# Altium project Ezlo_Voice_AssistantHUB.PrjPcb (part 2 of 10)

## Sheet WiFi_Module_Section.SchDoc
size A4; DocumentNumber: 21; SheetNumber: 21; SheetTotal: 27
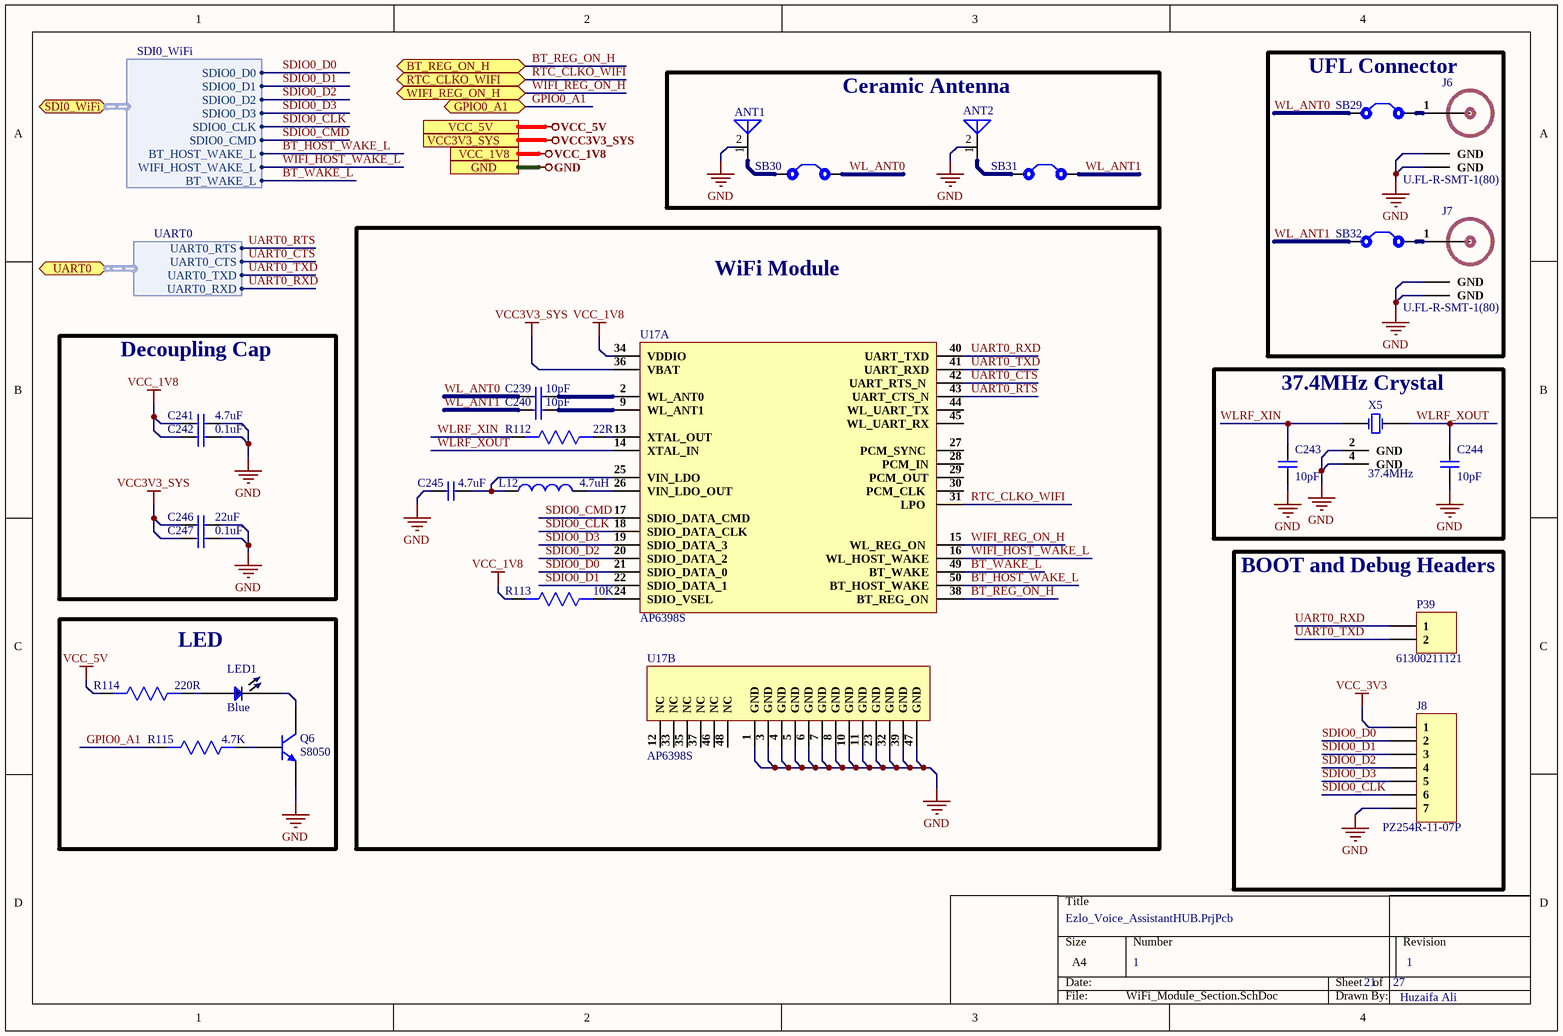
[diagram p2: WiFi_Module_Section.SchDoc]

### Parts
ANT1  RFANT5220110A2T  [RFANT5220110A2T]  (value not drawn)
ANT2  RFECA3216060K1T  [ANT 1206]  (value not drawn)
C239  10pF  [Cap0603]
C240  10pF  [Cap0603]
C241  4.7uF  [Cap0603]
C242  0.1uF  [Cap0402]
C243  10pF  [Cap0603]
C244  10pF  [Cap0603]
C245  4.7uF  [Cap0603]
C246  22uF  [Cap0805]
C247  0.1uF  [Cap0402]
J6  U.FL-R-SMT-1(80)  [U.FL-R-SMT-1(80)]
J7  U.FL-R-SMT-1(80)  [U.FL-R-SMT-1(80)]
J8  PZ254R-11-07P  [HDR1X7H]
L12  4.7uH  [SWPA4030S4R7MT]
LED1  Blue  [LED 0402]
P39  61300211121  [HDR1X2]
Q6  S8050  [SOT23-3]
R112  22R  [Res0603]
R113  10K  [Res0603]
R114  220R  [Res0603]
R115  4.7K  [Res0603]
SB29  Solder Bridge  [Solder Bridge]  (value not drawn)
SB30  Solder Bridge  [Solder Bridge]  (value not drawn)
SB31  Solder Bridge  [Solder Bridge]  (value not drawn)
SB32  Solder Bridge  [Solder Bridge]  (value not drawn)
U17  AP6398S  [AP6398S]  (parts A,B of 2)
X5  37.4MHz  [Q22FA12800078]

### Blocks framed on the sheet
Ceramic Antenna: ANT1 ANT2 SB30 SB31
UFL Connector: J6 J7 SB29 SB32
WiFi Module: C239 C240 C245 L12 R112 R113 U17
Decoupling Cap: C241 C242 C246 C247
37.4MHz Crystal: C243 C244 X5
BOOT and Debug Headers: J8 P39
LED: LED1 Q6 R114 R115

### Ports
BT_REG_ON_H (bidir), GND, GPIO0_A1 (bidir), RTC_CLKO_WIFI (bidir), SDI0_WiFi (bidir, harness SDI0_WiFi), UART0 (bidir, harness UART0), VCC3V3_SYS, VCC_1V8, VCC_5V, WIFI_REG_ON_H (bidir)

### Harnesses
UART0: UART0_RXD, UART0_TXD, UART0_CTS, UART0_RTS
SDI0_WiFi: SDIO0_D0, SDIO0_D1, SDIO0_D2, SDIO0_D3, SDIO0_CLK, SDIO0_CMD, BT_HOST_WAKE_L, WIFI_HOST_WAKE_L, BT_WAKE_L

### Nets
GND: ANT1.2(NC) ANT2.2 C241.2 C242.2 C243.1 C244.1 C245.2 C246.2 C247.2 J6.2(GND) J6.3(GND) J7.2(GND) J7.3(GND) J8.7 Q6.2(E) U17.1(GND) U17.3(GND) U17.4(GND) U17.5(GND) U17.6(GND) U17.7(GND) U17.8(GND) U17.10(GND) U17.11(GND) U17.23(GND) U17.32(GND) U17.39(GND) U17.47(GND) X5.2(GND) X5.4(GND) ; port GND
VCC3V3_SYS: C246.1 C247.1 U17.36(VBAT) ; port VCC3V3_SYS
VCC_1V8: C241.1 C242.1 R113.2 U17.34(VDDIO) ; port VCC_1V8
VCC_3V3: J8.1
VCC_5V: R114.2 ; port VCC_5V
BT_HOST_WAKE_L: U17.50(BT_HOST_WAKE) ; port SDI0_WiFi.BT_HOST_WAKE_L
BT_REG_ON_H: U17.38(BT_REG_ON) ; port BT_REG_ON_H
BT_WAKE_L: U17.49(BT_WAKE) ; port SDI0_WiFi.BT_WAKE_L
GPIO0_A1: R115.2 ; port GPIO0_A1
RTC_CLKO_WIFI: U17.31(LPO) ; port RTC_CLKO_WIFI
SDIO0_CLK: J8.6 U17.18(SDIO_DATA_CLK) ; port SDI0_WiFi.SDIO0_CLK  [project net SDI0_WiFi.SDIO0_CLK]
SDIO0_CMD: U17.17(SDIO_DATA_CMD) ; port SDI0_WiFi.SDIO0_CMD  [project net SDI0_WiFi.SDIO0_CMD]
SDIO0_D0: J8.2 U17.21(SDIO_DATA_0) ; port SDI0_WiFi.SDIO0_D0  [project net SDI0_WiFi.SDIO0_D0]
SDIO0_D1: J8.3 U17.22(SDIO_DATA_1) ; port SDI0_WiFi.SDIO0_D1  [project net SDI0_WiFi.SDIO0_D1]
SDIO0_D2: J8.4 U17.20(SDIO_DATA_2) ; port SDI0_WiFi.SDIO0_D2  [project net SDI0_WiFi.SDIO0_D2]
SDIO0_D3: J8.5 U17.19(SDIO_DATA_3) ; port SDI0_WiFi.SDIO0_D3  [project net SDI0_WiFi.SDIO0_D3]
UART0_CTS: U17.42(UART_RTS_N) ; port UART0.UART0_CTS  [project net UART0.UART0_CTS]
UART0_RTS: U17.43(UART_CTS_N) ; port UART0.UART0_RTS  [project net UART0.UART0_RTS]
UART0_RXD: P39.1 U17.40(UART_TXD) ; port UART0.UART0_RXD  [project net UART0.UART0_RXD]
UART0_TXD: P39.2 U17.41(UART_RXD) ; port UART0.UART0_TXD  [project net UART0.UART0_TXD]
WIFI_HOST_WAKE_L: U17.16(WL_HOST_WAKE) ; port SDI0_WiFi.WIFI_HOST_WAKE_L  [project net SDI0_WiFi.WIFI_HOST_WAKE_L]
WIFI_REG_ON_H: U17.15(WL_REG_ON) ; port WIFI_REG_ON_H
WL_ANT0: C239.1 SB29.1 SB30.2
WL_ANT1: C240.1 SB31.2 SB32.1
WLRF_XIN: C243.2 R112.2 X5.1(CRYSTAL)
WLRF_XOUT: C244.2 U17.14(XTAL_IN) X5.3(CRYSTAL)
NetANT1_1: ANT1.1(A) SB30.1
NetANT2_1: ANT2.1 SB31.1
NetC239_2: C239.2 U17.2(WL_ANT0)
NetC240_2: C240.2 U17.9(WL_ANT1)
NetC245_1: C245.1 L12.1 U17.25(VIN_LDO)
NetJ6_1: J6.1(RF_IN) SB29.2
NetJ7_1: J7.1(RF_IN) SB32.2
NetL12_2: L12.2 U17.26(VIN_LDO_OUT)
NetLED1_1: LED1.1 R114.1
NetLED1_2: LED1.2 Q6.3(C)
NetQ6_1: Q6.1(B) R115.1
NetR112_1: R112.1 U17.13(XTAL_OUT)
NetR113_1: R113.1 U17.24(SDIO_VSEL)

Not connected (* = marked no-connect by the designer): U17 12(NC) 27(PCM_SYNC_) 28(PCM_IN) 29(PCM_OUT) 30(PCM_CLK_) 33(NC) 35(NC) 37(NC) 44(WL_UART_TX) 45(WL_UART_RX) 46(NC) 48(NC)

### Notes on the sheet
- 1
- Huzaifa Ali

### Library data of the parts
ANT1 = RFANT5220110A2T: SMD,5.2x2x1.1mm Antennas ROHS; Manufacturer: Walsin Tech; ComponentLink1Description: LCSC; ComponentLink1URL: https://www.lcsc.com/product-detail/Antennas_Walsin-Tech-Corp-RFANT5220110A2T_C201761.html; Manufacturer Part Number: RFANT5220110A2T; Footprint: Custom
ANT2 = RFECA3216060K1T: 1206 Antennas ROHS; Manufacturer: Walsin Tech Corp; ComponentLink1Description: LCSC; ComponentLink1URL: https://www.lcsc.com/product-detail/Antennas_Walsin-Tech-Corp-RFECA3216060K1T_C2992318.html; Manufacturer Part Number: RFECA3216060K1T; Footprint: 1206
C239 C240 C243 C244 = CC0603JRNPO9BN100: CAP CER 10PF 50V C0G/NPO 0603; Manufacturer: Yageo; Tolerance: 5%; Dielectric: C0G; Temperature Coefficient: 30ppm/°C; Insulation Resistance: 100GR; ComponentLink1URL: https://datasheet.ciiva.com/25787/cl10a475ka8nqnc-25787017.pdf?src-supplier=Digi-Key; ComponentLink1Description: https://datasheet.ciiva.com/25787/cl10a475ka8nqnc-25787017.pdf?src-supplier=Digi-Key; ComponentLink2URL: https://datasheet.ciiva.com/144/mlccorderingcode-144651.pdf?src-supplier=Digi-Key; ComponentLink2Description: https://datasheet.ciiva.com/144/mlccorderingcode-144651.pdf?src-supplier=Digi-Key; ComponentLink3URL: https://datasheet.ciiva.com/11786/0900766b8079c870-11786407.pdf?src-supplier=RSComponents; ComponentLink3Description: https://datasheet.ciiva.com/11786/0900766b8079c870-11786407.pdf?src-supplier=RSComponents; ComponentLink4URL: https://datasheet.ciiva.com/5789/1734582-5789616.pdf?src-supplier=Farnell; ComponentLink4Description: https://datasheet.ciiva.com/5789/1734582-5789616.pdf?src-supplier=Farnell; ComponentLink5URL: https://datasheet.ciiva.com/26862/getdatasheetpartid-403524-26862758.pdf?src-supplier=Verical; ComponentLink5Description: https://datasheet.ciiva.com/26862/getdatasheetpartid-403524-26862758.pdf?src-supplier=Verical; ComponentLink6URL: https://datasheet.ciiva.com/7978/1132289-7978126.pdf?src-supplier=Element14; ComponentLink6Description: https://datasheet.ciiva.com/7978/1132289-7978126.pdf?src-supplier=Element14; ComponentLink7URL: https://datasheet.ciiva.com/46430/1835847-46430150.pdf?src-supplier=Element14; ComponentLink7Description: https://datasheet.ciiva.com/46430/1835847-46430150.pdf?src-supplier=Element14; ComponentLink8URL: https://datasheet.ciiva.com/144/mlccorderingcode-144650.pdf?src-supplier=Digi-Key; ComponentLink8Description: https://datasheet.ciiva.com/144/mlccorderingcode-144650.pdf?src-supplier=Digi-Key; ComponentLink9URL: https://datasheet.ciiva.com/144/mlccorderingcode-144649.pdf?src-supplier=Digi-Key; ComponentLink9Description: https://datasheet.ciiva.com/144/mlccorderingcode-144649.pdf?src-supplier=Digi-Key; ComponentLink10URL: https://datasheet.ciiva.com/5425/upy-gp-np0-16v-to-50v-8-5425564.pdf?src-supplier=Mouser; ComponentLink10Description: https://datasheet.ciiva.com/5425/upy-gp-np0-16v-to-50v-8-5425564.pdf?src-supplier=Mouser; ComponentLink11URL: https://datasheet.ciiva.com/8033/1734582-8033710.pdf?src-supplier=Element14; ComponentLink11Description: https://datasheet.ciiva.com/8033/1734582-8033710.pdf?src-supplier=Element14; ComponentLink12URL: https://datasheet.ciiva.com/8033/1734582-8033706.pdf?src-supplier=Element14; ComponentLink12Description: https://datasheet.ciiva.com/8033/1734582-8033706.pdf?src-supplier=Element14; Supplier 1: Digi-Key; Manufacturer Part Number: CC0603JRNPO9BN100; RoHS: Yes; Category: Ceramic Capacitors; Stock 1: 1700978; Pricing 1: 1=0.10000, 10=0.03900, 50=0.02120, 100=0.01740, 500=0.01240, 1000=0.00974 (USD); Mount: Surface Mount; Case/Package: 0603; Number of Pins: 2; Case Code (Metric): 1608; Case Code (Imperial): 0603; Min Operating Temperature: -55°C; Max Operating Temperature: 125°C; Capacitance: 10pF; Voltage: 50V; Voltage Rating: 50V; Voltage Rating (DC): 50V; Packaging: Tape and Reel; Package Quantity: 1; Termination: SMD/SMT; Resistor Type: Ceramic; Series: CC; Length: 1.6mm; Width: 0.031inch; Height: 0.8mm; Thickness: 0.035inch; Depth: 0.8mm; Radiation Hardening: No; RoHS Compliant: Yes; REACH SVHC: No SVHC; Lead Free: Lead Free; Supplier Part Number 1: 311-1058-1-ND
C241 C245 = CL10A475KA8NQNC: CAP CER 4.7UF 25V X5R 0603; Manufacturer: Samsung; Tolerance: 10%; Supplier 1: Arrow Electronics; Manufacturer Part Number: CL10A475KA8NQNC; RoHS: Yes; Category: Ceramic Capacitors; Stock 1: 260000; Pricing 1: 4000=0.08490, 8000=0.05240, 16000=0.05180, 24000=0.05130, 40000=0.05070 (USD); Mount: Surface Mount; Case/Package: 0603; Case Code (Metric): 1608; Case Code (Imperial): 0603; Contact Plating: Tin; Min Operating Temperature: -55°C; Max Operating Temperature: 85°C; Package Quantity: 1; Packaging: Tape and Reel; Capacitance: 4.7uF; Voltage Rating: 25V; Dielectric: X5R; Series: CL; Termination: Wraparound; Construction: Flat; Length: 1.6mm; Width: 0.031inch; Thickness: 0.035inch; Depth: 0.8mm; Lead Free: Lead Free; RoHS Compliant: Yes; ComponentLink1URL: https://datasheet.ciiva.com/25787/cl10a475ka8nqnc-25787017.pdf?src-supplier=Digi-Key; ComponentLink1Description: https://datasheet.ciiva.com/25787/cl10a475ka8nqnc-25787017.pdf?src-supplier=Digi-Key; Supplier Part Number 1: CL10A475KA8NQNC
C242 C247 = CC0402KRX5R6BB104: CAP CER 0.1UF 10V X5R 0402; Manufacturer: Yageo; Capacitance: 100nF; Tolerance: 10%; Dissipation Factor: 5%; Insulation Resistance: 10GR; Supplier 1: Digi-Key; Manufacturer Part Number: CC0402KRX5R6BB104; RoHS: Yes; Category: Ceramic Capacitors; Stock 1: 6385580; Pricing 1: 1=0.10000, 10=0.02700, 50=0.01500, 100=0.01220, 500=0.00874, 1000=0.00687, 2500=0.00625, 5000=0.00575 (USD); Mount: Surface Mount; Case/Package: 0402; Number of Pins: 2; Case Code (Imperial): 0402; Case Code (Metric): 1005; Min Operating Temperature: -55°C; Max Operating Temperature: 85°C; Dielectric: X5R; Packaging: Tape and Reel; Voltage Rating: 10V; Package Quantity: 1; Termination: SMD/SMT; Voltage Rating (DC): 10V; Series: CC; Length: 1mm; Width: 0.02inch; Height: 0.5mm; Depth: 0.5mm; Thickness: 0.022inch; Radiation Hardening: No; RoHS Compliant: Yes; REACH SVHC: No SVHC; Lead Free: Lead Free; Halogen Free: Halogen Free; ComponentLink1URL: https://datasheet.ciiva.com/144/mlccorderingcode-144029.pdf?src-supplier=Digi-Key; ComponentLink1Description: https://datasheet.ciiva.com/144/mlccorderingcode-144029.pdf?src-supplier=Digi-Key; ComponentLink2URL: https://datasheet.ciiva.com/144/mlccorderingcode-144028.pdf?src-supplier=Digi-Key; ComponentLink2Description: https://datasheet.ciiva.com/144/mlccorderingcode-144028.pdf?src-supplier=Digi-Key; ComponentLink3URL: https://datasheet.ciiva.com/144/mlccorderingcode-144030.pdf?src-supplier=Digi-Key; ComponentLink3Description: https://datasheet.ciiva.com/144/mlccorderingcode-144030.pdf?src-supplier=Digi-Key; ComponentLink4URL: https://datasheet.ciiva.com/7978/1359354-7978091.pdf?src-supplier=Element14; ComponentLink4Description: https://datasheet.ciiva.com/7978/1359354-7978091.pdf?src-supplier=Element14; ComponentLink5URL: https://datasheet.ciiva.com/11587/upy-gphc-x5r-4v-to-50v-12-11587302.pdf?src-supplier=Avnet; ComponentLink5Description: https://datasheet.ciiva.com/11587/upy-gphc-x5r-4v-to-50v-12-11587302.pdf?src-supplier=Avnet; Supplier Part Number 1: 311-1336-1-ND
C246 = CL21A226MAYNNNE: 0803 22uF 25V X5R 20% multilayer ceramic capacitor; Manufacturer: Samsung; Supplier 1: Digi-Key; Manufacturer Part Number: CL21A226MAYNNNE; RoHS: Yes; Category: Ceramic Capacitors; Stock 1: 442950; Pricing 1: 2000=0.07687, 4000=0.07110, 10000=0.06726, 14000=0.06380, 50000=0.05765 (USD); RoHS Compliant: Yes; Supplier Part Number 1: 1276-CL21A226MAYNNNETR-ND
J6 J7 = U.FL-R-SMT-1(80): CONN U.FL RCPT STR 50 OHM SMD; Manufacturer: Hirose; Supplier 1: Future Electronics; Manufacturer Part Number: U.FL-R-SMT-1(80); Stock 1: 1272; Pricing 1: 1=1.07, 500=0.785, 1500=0.74, 2500=0.72, 5000=0.695 (USD); Case/Package: SMD/SMT; Package Quantity: 10000; Packaging: Tape and Reel; Lead Free: Lead Free; ComponentLink1URL: https://www.hirose.com/product/en/download_file/key_name/U.FL-R-SMT-1%2880%29/category/Specification%20Sheet/doc_file_id/37638/?file_category_id=9&item_id=03310472280&is_series=&src-supplier=Digi-Key; ComponentLink1Description: https://www.hirose.com/product/en/download_file/key_name/U.FL-R-SMT-1%2880%29/category/Specification%20Sheet/doc_file_id/37638/?file_category_id=9&item_id=03310472280&is_series=&src-supplier=Digi-Key; ComponentLink2URL: http://www.mouser.com/ds/2/185/U.FL_catalog-939761.pdf?src-supplier=Mouser; ComponentLink2Description: http://www.mouser.com/ds/2/185/U.FL_catalog-939761.pdf?src-supplier=Mouser; Supplier Part Number 1: U.FL-R-SMT-1(80)-CUTT
J8 = PZ254R-11-07P: Shrouded Square Pins 2.5mm 6mm -40℃~+105℃ 1 7 2.54mm Black Brass 1x7P Plugin,P=2.54mm Pin Headers ROHS; Manufacturer: XFCN; Manufacturer Part Number: PZ254R-11-07P; Footprint: Custom; ComponentLink1Description: LCSC; ComponentLink1URL: https://lcsc.com/product-detail/Pin-Headers_XFCN-PZ254R-11-07P_C492415.html
L12 = SWPA4030S4R7MT: Fixed Ind 4.720%UH 0.06 Ohm 3200M; Manufacturer: Sunlord; Supplier 1: Digi-Key; Manufacturer Part Number: SWPA4030S4R7MT; RoHS: Yes; Category: Fixed Inductors; Stock 1: 3730; Pricing 1: 1=0.44000, 10=0.38900, 25=0.36120, 50=0.30560, 100=0.27780, 250=0.26108, 500=0.23332, 1000=0.18887 (USD); RoHS Compliant: Yes; Supplier Part Number 1: 3442-SWPA4030S4R7MTCT-ND
LED1 = XZCBD68W-2: LED BLUE CLEAR 0402
P39 = 61300211121: CONN HEADER VERT 2POS 2.54MM; Manufacturer: Wurth Electronics; Current Rating: 3A; Voltage Rating: 250V; Number of Positions: 2; Gender: Male; Connector Type: Male Pin; Pitch: 0.1inch; Supplier 1: Digi-Key; Manufacturer Part Number: 61300211121; Stock 1: 219205; Pricing 1: 1=0.13, 10=0.106, 25=0.088, 50=0.074, 100=0.067, 1000=0.061 (USD); Mount: Through Hole; Contact Plating: Gold; Housing Material: PBT; Contact Material: Copper Alloy,Copper; Color: Black; Min Operating Temperature: -40°C; Max Operating Temperature: 125°C; Number of Rows: 1; Contact Gender: Male; Packaging: Bulk; Termination: Through Hole; Number of Contacts: 2; Contact Mating Length: 0.236inch; REACH SVHC: Unknown; Lead Free: Lead Free; ComponentLink1URL: http://www.mouser.com/ds/2/445/6130xx11121-538006.pdf?src-supplier=Mouser; ComponentLink1Description: http://www.mouser.com/ds/2/445/6130xx11121-538006.pdf?src-supplier=Mouser; Supplier Part Number 1: 732-5315-ND
Q6 = S8050: Trans Gp Bjt NPN 25V 1.5A 300MW 3-PIN SOT-23 T/r; Manufacturer: Comchip; Manufacturer Part Number: SS8050-G; Collector Emitter Voltage (VCEO): 400mV; Transition Frequency: 100MHz; Supplier 1: Arrow Electronics; RoHS: Yes; Stock 1: 2514; Pricing 1: 1=0.26480, 10=0.19960, 25=0.19760, 50=0.19590, 100=0.09990, 250=0.09890, 500=0.07670, 1000=0.05180 (USD); Mount: Surface Mount; Case/Package: TO-236-3; Packaging: Tape and Reel; Max Power Dissipation: 300mW; Max Collector Current: 1.5A; Collector Emitter Breakdown Voltage: 25V; Max Breakdown Voltage: 25V; ComponentLink1URL: http://www.comchiptech.com/admin/files/product/SS8050-G RevA181526.pdf?src-supplier=Digi-Key; ComponentLink1Description: http://www.comchiptech.com/admin/files/product/SS8050-G RevA181526.pdf?src-supplier=Digi-Key; ComponentLink2URL: http://www.comchiptech.com/cms/UserFiles/SS8050-G%20RevA181526.pdf?src-supplier=Digi-Key; ComponentLink2Description: http://www.comchiptech.com/cms/UserFiles/SS8050-G%20RevA181526.pdf?src-supplier=Digi-Key; Supplier Part Number 1: SS8050-G
R112 = CRCW060322R0JNEAHP: RES SMD 22 OHM 5% 1/3W 0603; Manufacturer: Vishay Dale; Temperature Coefficient: 200ppm/°C; Power Rating: 250mW; Voltage Rating: 75V; Supplier 1: Digi-Key; Manufacturer Part Number: CRCW060322R0JNEAHP; Stock 1: 245392; Pricing 1: 1=0.15, 10=0.129, 100=0.0506, 1000=0.02119, 2500=0.01942 (USD); Mount: Surface Mount; Case/Package: 0603; Weight: 7.1E-05oz; Contact Plating: Tin; Case Code (Imperial): 0603; Case Code (Metric): 1608; Min Operating Temperature: -55°C; Max Operating Temperature: 155°C; Resistance: 22R; Tolerance: 5%; Composition: Thick Film; Packaging: Tape and Reel; Package Quantity: 5000; Military Standard: Not; Length: 1.6mm; Height: 0.45mm; Width: 0.8mm; Depth: 0.85mm; Radiation Hardening: No; Lead Free: Lead Free; ComponentLink1URL: http://www.vishay.com/docs/20043/crcwhpe3.pdf?src-supplier=Avnet+Europe; ComponentLink1Description: http://www.vishay.com/docs/20043/crcwhpe3.pdf?src-supplier=Avnet+Europe; ComponentLink2URL: http://www.mouser.com/ds/2/427/dcrcwe3-109170.pdf?src-supplier=Mouser; ComponentLink2Description: http://www.mouser.com/ds/2/427/dcrcwe3-109170.pdf?src-supplier=Mouser; Supplier Part Number 1: 541-22SACT-ND
R113 = AC0603JR-0710KL: RES SMD 10K OHM 5% 1/10W 0603; Manufacturer: Yageo; Voltage Rating: 50V; Resistance: 10kR; Power Rating: 100mW; Temperature Coefficient: 100ppm/°C; Supplier 1: Future Electronics; Manufacturer Part Number: AC0603JR-0710KL; RoHS: Yes; Category: Chip SMD Resistors; Stock 1: 1533000; Pricing 1: 5000=0.00540 (USD); Case/Package: 0603; Case Code (Imperial): 0603; Case Code (Metric): 1608; Size Code: 0603; Min Operating Temperature: -55°C; Max Operating Temperature: 155°C; Packaging: Tape and Reel; Tolerance: 5%; Package Quantity: 1; Resistor Type: Thick Film; Termination: SMD/SMT; Number of Terminations: 2; Max Power Dissipation: 100mW; Features: Moisture Resistant,Automotive AEC-Q200,Anti-Sulfur; Series: AC; Construction: Rectangular; Length: 0.063inch; Width: 0.031inch; Height: 0.022inch; Depth: 0.8mm; Military Standard: Not; Lead Free: Lead Free; RoHS Compliant: Yes; ComponentLink1URL: https://datasheet.ciiva.com/5562/pyu-ac-51-rohs-l-2-5562553.pdf?src-supplier=Mouser; ComponentLink1Description: https://datasheet.ciiva.com/5562/pyu-ac-51-rohs-l-2-5562553.pdf?src-supplier=Mouser; Supplier Part Number 1: 1029044
R114 = RC0603FR-07220RL: RES SMD 220 OHM 1% 1/10W 0603; Manufacturer: Yageo; Temperature Coefficient: 100ppm/°C; Voltage Rating (DC): 50V; Power Rating: 100mW; Supplier 1: Digi-Key; Manufacturer Part Number: RC0603FR-07220RL; Stock 1: 5843995; Pricing 1: 1=0.1, 10=0.023, 100=0.0094, 1000=0.00421, 2500=0.00366 (USD); Case/Package: 0603; Number of Pins: 2; Case Code (Imperial): 0603; Case Code (Metric): 1608; Min Operating Temperature: -55°C; Max Operating Temperature: 155°C; Resistance: 220R; Tolerance: 1%; Composition: Thick Film; Packaging: Tape and Reel; Voltage Rating: 50V; Package Quantity: 1; Termination: SMD/SMT; Number of Terminations: 2; Military Standard: Not; Max Power Dissipation: 100mW; Features: Moisture Resistant; Length: 1.6mm; Height: 0.022inch; Width: 0.031inch; Depth: 0.8mm; REACH SVHC: No SVHC; Lead Free: Lead Free; ComponentLink1URL: http://www.yageo.com/documents/recent/PYu-RC_Group_51_RoHS_L_10.pdf?src-supplier=Digi-Key; ComponentLink1Description: http://www.yageo.com/documents/recent/PYu-RC_Group_51_RoHS_L_10.pdf?src-supplier=Digi-Key; ComponentLink2URL: http://www.farnell.com/datasheets/1868787.pdf?src-supplier=Element14; ComponentLink2Description: http://www.farnell.com/datasheets/1868787.pdf?src-supplier=Element14; Supplier Part Number 1: 311-220HRCT-ND
R115 = RC0603JR-074K7L: RES SMD 4.7K OHM 5% 1/10W 0603; Manufacturer: Yageo; Resistance: 4.7kR; Temperature Coefficient: 100ppm/°C; Voltage Rating (DC): 50V; Power Rating: 100mW; Supplier 1: Digi-Key; Manufacturer Part Number: RC0603JR-074K7L; Stock 1: 19706643; Pricing 1: 1=0.1, 10=0.02, 100=0.0081, 1000=0.00362, 2500=0.00314 (USD); Case/Package: 0603; Number of Pins: 2; Case Code (Imperial): 0603; Case Code (Metric): 1608; Min Operating Temperature: -55°C; Max Operating Temperature: 155°C; Tolerance: 5%; Composition: Thick Film; Packaging: Tape and Reel; Voltage Rating: 50V; Termination: SMD/SMT; Military Standard: Not; Length: 1.6mm; Width: 0.8mm; Depth: 0.8mm; REACH SVHC: No SVHC; Lead Free: Lead Free; ComponentLink1URL: http://www.farnell.com/datasheets/443971.pdf?src-supplier=Element14; ComponentLink1Description: http://www.farnell.com/datasheets/443971.pdf?src-supplier=Element14; Supplier Part Number 1: 311-4.7KGRCT-ND
SB29-SB32 = Solder Bridge: Solder Bridge ON
U17 = AP6398S: 802.11ac/a/b/g/n 2x2 WiFi with Bluetooth5.0 Combo SIP Module; Manufacturer: SparkLAN; Manufacturer Part Number: AP6398S; Footprint: Custom; ComponentLink1Description: Verical; ComponentLink1URL: https://www.verical.com/pd/sparklan-communicationslnc.-combo-wireless-module-ap6398s-7079266?utm_medium=datasheet&utm_source=pdf&utm_content=link&utm_term=AP6398S&utm_campaign=datasheet_coverpage_2017
X5 = Q22FA12800078: 37.4MHz SMD Crystal Resonator 9pF 60Ω ±10ppm -40℃~+85℃ SMD2016-4P Crystals; Mnufacturer: Seiko Epson; Frequency: 37.4MHz; Load Capacitance: 9pF; Equivalent Series Resistance (ESR): 60Ω

## Sheet Connector_Section.SchDoc
size A4; DocumentNumber: 27; SheetNumber: 27; SheetTotal: 27
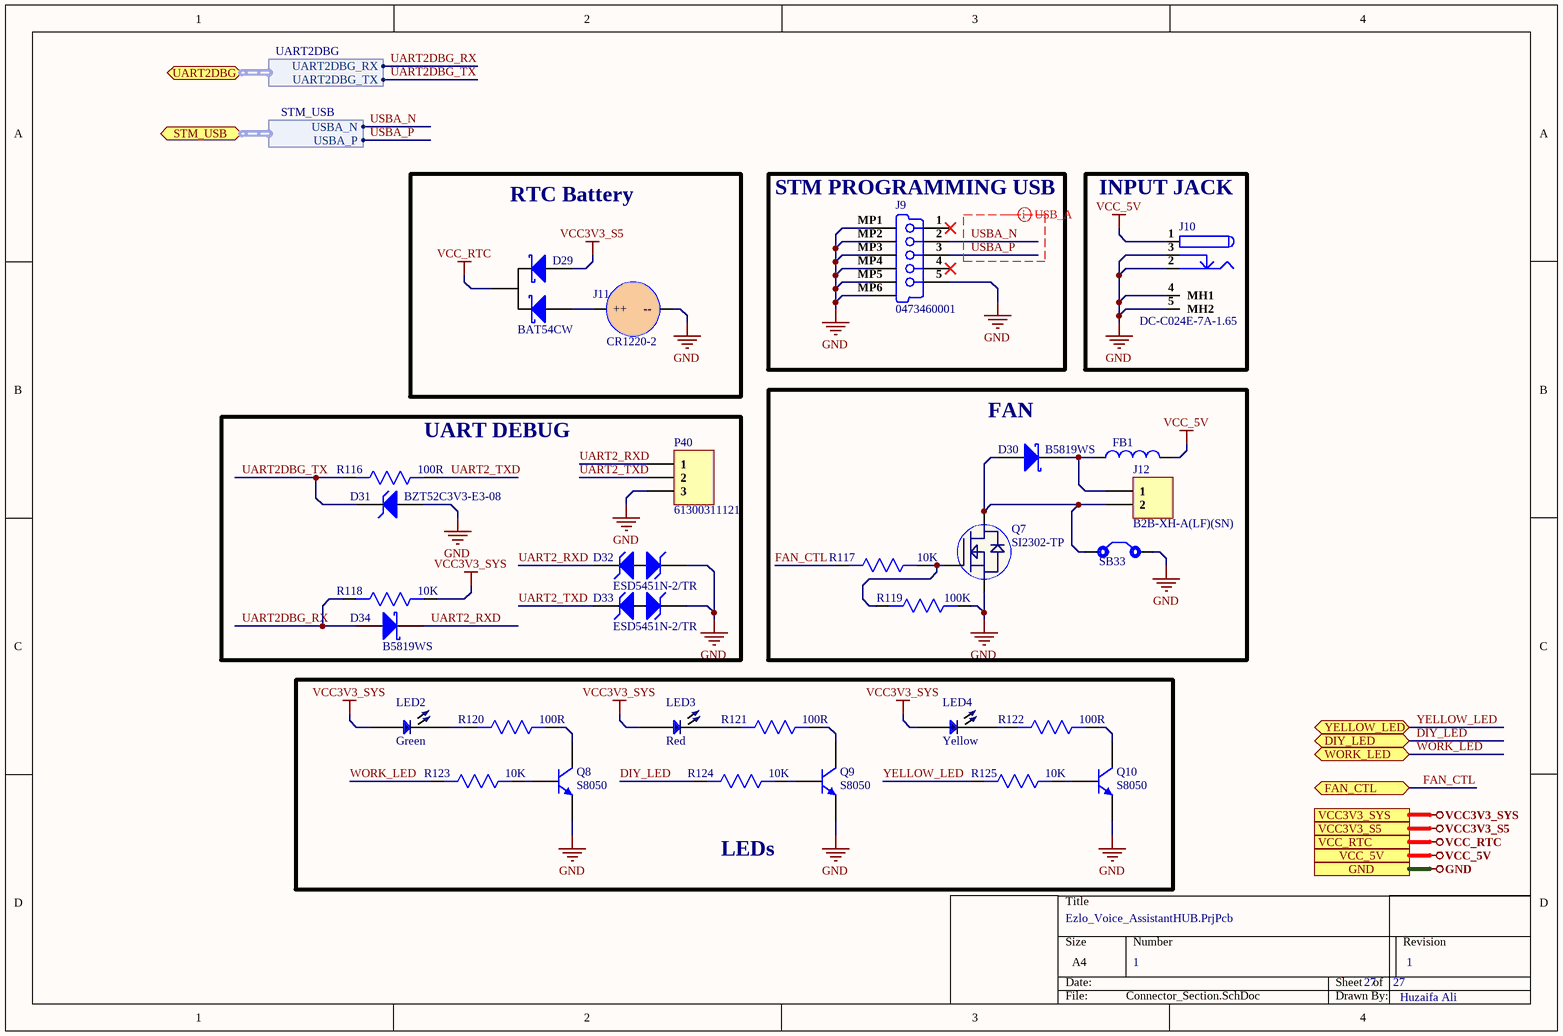
[diagram p3: Connector_Section.SchDoc]

### Parts
D29  BAT54CW  [SOT-323]
D30  B5819WS  [SOD-323]
D31  BZT52C3V3-E3-08  [SOD-123]
D32  ESD5451N-2/TR  [DFN1006-2L]
D33  ESD5451N-2/TR  [DFN1006-2L]
D34  B5819WS  [SOD-323]
FB1  MPZ1608S121ATDH5  [MPZ1608S121ATDH5]  (value not drawn)
J9  0473460001  [0473460001]
J10  DC-C024E-7A-1.65  [DC-C024E-7A-1.65]
J11  CR1220-2  [CR1220-2]
J12  B2B-XH-A(LF)(SN)  [B2B-XH-A(LF)(SN)]
LED2  Green  [LED 0402]
LED3  Red  [LED 0402]
LED4  Yellow  [LED 0402]
P40  61300311121  [HDR1X3]
Q7  SI2302-TP  [SI2302-TP]
Q8  S8050  [SOT23-3]
Q9  S8050  [SOT23-3]
Q10  S8050  [SOT23-3]
R116  100R  [Res0603]
R117  10K  [Res0603]
R118  10K  [Res0603]
R119  100K  [Res0603]
R120  100R  [Res0603]
R121  100R  [Res0603]
R122  100R  [Res0603]
R123  10K  [Res0603]
R124  10K  [Res0603]
R125  10K  [Res0603]
SB33  Solder Bridge  [Solder Bridge]  (value not drawn)

### Blocks framed on the sheet
RTC Battery: D29 J11
STM PROGRAMMING USB: J9
INPUT JACK: J10
FAN: D30 FB1 J12 Q7 R117 R119 SB33
UART DEBUG: D31-D34 P40 R116 R118
LEDs: LED2-LED4 Q8-Q10 R120-R125

### Ports
DIY_LED (bidir), FAN_CTL (bidir), GND, STM_USB (bidir, harness STM_USB), UART2DBG (bidir, harness UART2DBG), VCC3V3_S5, VCC3V3_SYS, VCC_5V, VCC_RTC, WORK_LED (bidir), YELLOW_LED (bidir)

### Harnesses
STM_USB: USBA_N, USBA_P
UART2DBG: UART2DBG_TX, UART2DBG_RX

### Nets
GND: D31.1(A) D32.2(k) D33.2(k) J9.5(GND) J9.MP1(Tab) J9.MP2(Tab) J9.MP3(Tab) J9.MP4(Tab) J9.MP5(Tab) J9.MP6(Tab) J10.2 J10.3 J10.4(MH1) J10.5(MH2) J11.2(--) P40.3 Q7.2(S) Q8.2(E) Q9.2(E) Q10.2(E) R119.1 SB33.2 ; port GND
VCC3V3_S5: D29.2(A2) ; port VCC3V3_S5
VCC3V3_SYS: LED2.1 LED3.1 LED4.1 R118.1 ; port VCC3V3_SYS
VCC_5V: FB1.2 J10.1 ; port VCC_5V
VCC_RTC: D29.3(K) ; port VCC_RTC
DIY_LED: R124.2 ; port DIY_LED
FAN_CTL: R117.2 ; port FAN_CTL
UART2_RXD: D32.1(K) D34.1(K) P40.1
UART2_TXD: D33.1(K) P40.2 R116.1
UART2DBG_RX: D34.2(A) R118.2 ; port UART2DBG.UART2DBG_RX  [project net UART2DBG.UART2DBG_RX]
UART2DBG_TX: D31.2(K) R116.2 ; port UART2DBG.UART2DBG_TX  [project net UART2DBG.UART2DBG_TX]
USBA_N: J9.2(D-) ; port STM_USB.USBA_N
USBA_P: J9.3(D+) ; port STM_USB.USBA_P
WORK_LED: R123.2 ; port WORK_LED
YELLOW_LED: R125.2 ; port YELLOW_LED
NetD29_1: D29.1(A1) J11.1(++)
NetD30_1: D30.1(K) FB1.1 J12.1
NetD30_2: D30.2(A) J12.2 Q7.3(D) SB33.1
NetLED2_2: LED2.2 R120.2
NetLED3_2: LED3.2 R121.2
NetLED4_2: LED4.2 R122.2
NetQ7_1: Q7.1(G) R117.1 R119.2
NetQ8_1: Q8.1(B) R123.1
NetQ8_3: Q8.3(C) R120.1
NetQ9_1: Q9.1(B) R124.1
NetQ9_3: Q9.3(C) R121.1
NetQ10_1: Q10.1(B) R125.1
NetQ10_3: Q10.3(C) R122.1

Not connected (* = marked no-connect by the designer): J9 1(V_BUS_(5V))* 4(ID)*; J11 MH1 MH2

### Layout directives
differential pair; rule Matched Net Lengths [Tolerance = 50mil]; rule Impedance Constraint [Min = 85.00    Max = 95.00    ]; differential pair class USB_A_Lines; net class USB_A: USBA_N, USBA_P

### Notes on the sheet
- 1
- Huzaifa Ali

### Library data of the parts
D29 = BAT54CW: DIODE SCHOTTKY 30V 100MA SOT323; Manufacturer: ON Semiconductor / Fairchild; Manufacturer Part Number: BAT54CWT1G; Element Configuration: Common Cathode; Forward Current: 200mA; Forward Voltage: 800mV; Reverse Recovery Time: 5ns; Peak Non-Repetitive Surge Current: 600mA; Max Reverse Current: 2uA; Power Dissipation: 200mW; Supplier 1: Mouser; RoHS: Yes; Category: Schottky Diodes; Pricing 1: 1=0.22000, 10=0.18400, 50=0.18400, 100=0.09800, 500=0.06400, 1000=0.04400, 3000=0.03400, 10000=0.03400 (USD); Mount: Surface Mount; Case/Package: SOT-323; Number of Pins: 3; Contact Plating: Tin,Matte; Weight: 0.03g; Min Operating Temperature: -55°C; Max Operating Temperature: 125°C; Packaging: Tape and Reel; Package Quantity: 1; Max Repetitive Reverse Voltage (Vrrm): 30V; Average Rectified Current: 200mA; Max Forward Surge Current (Ifsm): 600mA; Max Reverse Voltage (DC): 30V; Max Surge Current: 600mA; Max Reverse Leakage Current: 2uA; Series: -; Recovery Time: 5ns; Length: 2.2mm; Width: 1.35mm; Height: 0.9mm; Radiation Hardening: No; RoHS Compliant: Yes; Lead Free: Lead Free; REACH SVHC: No SVHC; ComponentLink1URL: https://datasheet.ciiva.com/905/bat54cwt1-d-905845.pdf?src-supplier=Digi-Key; ComponentLink1Description: https://datasheet.ciiva.com/905/bat54cwt1-d-905845.pdf?src-supplier=Digi-Key; ComponentLink2URL: https://datasheet.ciiva.com/28381/1708235-28381253.pdf?src-supplier=Element14; ComponentLink2Description: https://datasheet.ciiva.com/28381/1708235-28381253.pdf?src-supplier=Element14; ComponentLink3URL: https://datasheet.ciiva.com/22651/1706529-22651951.pdf?src-supplier=Element14; ComponentLink3Description: https://datasheet.ciiva.com/22651/1706529-22651951.pdf?src-supplier=Element14; ComponentLink4URL: https://datasheet.ciiva.com/4715/bat54cwt1g-102392-4715466.pdf?src-supplier=Mouser; ComponentLink4Description: https://datasheet.ciiva.com/4715/bat54cwt1g-102392-4715466.pdf?src-supplier=Mouser; ComponentLink5URL: https://datasheet.ciiva.com/4715/bat54cwt1-d-111181-4715156.pdf?src-supplier=Mouser; ComponentLink5Description: https://datasheet.ciiva.com/4715/bat54cwt1-d-111181-4715156.pdf?src-supplier=Mouser; ComponentLink6URL: https://datasheet.ciiva.com/22659/1708235-22659015.pdf?src-supplier=Element14; ComponentLink6Description: https://datasheet.ciiva.com/22659/1708235-22659015.pdf?src-supplier=Element14; ComponentLink7URL: https://datasheet.ciiva.com/8303/bat54cwt1g-8303708.pdf?src-supplier=Avnet; ComponentLink7Description: https://datasheet.ciiva.com/8303/bat54cwt1g-8303708.pdf?src-supplier=Avnet; ComponentLink8URL: https://datasheet.ciiva.com/8303/bat54cwt1g-8303706.pdf?src-supplier=Avnet; ComponentLink8Description: https://datasheet.ciiva.com/8303/bat54cwt1g-8303706.pdf?src-supplier=Avnet; ComponentLink9URL: https://datasheet.ciiva.com/6390/bat54cwt1g-6390474.pdf?src-supplier=Digi-Key; ComponentLink9Description: https://datasheet.ciiva.com/6390/bat54cwt1g-6390474.pdf?src-supplier=Digi-Key; ComponentLink10URL: https://datasheet.ciiva.com/905/bat54cwt1-d-905846.pdf?src-supplier=Digi-Key; ComponentLink10Description: https://datasheet.ciiva.com/905/bat54cwt1-d-905846.pdf?src-supplier=Digi-Key; ComponentLink11URL: https://datasheet.ciiva.com/905/bat54cwt1-d-905847.pdf?src-supplier=Digi-Key; ComponentLink11Description: https://datasheet.ciiva.com/905/bat54cwt1-d-905847.pdf?src-supplier=Digi-Key; Supplier Part Number 1: 863-BAT54CWT1G
D30 D34 = B5819WS: DIODE SCHOTTKY 40V 1A SOD323; Manufacturer: MDD; Manufacturer Part Number: B5819WS-TP; Max Surge Current: 10A; Forward Voltage: 900mV; Max Reverse Leakage Current: 1mA; Element Configuration: Single; Supplier 1: Arrow Electronics; RoHS: Yes; Category: Rectifier Diodes; Stock 1: 1701; Pricing 1: 1=0.34370, 10=0.18990, 25=0.18810, 100=0.11820, 250=0.11700, 500=0.08890, 1000=0.07420 (USD); Mount: Surface Mount; Number of Pins: 2; Min Operating Temperature: -65°C; Max Operating Temperature: 125°C; Package Quantity: 1; Packaging: Tape and Reel; Average Rectified Current: 1A; Peak Non-Repetitive Surge Current: 10A; Max Reverse Voltage (DC): 40V; Series: -; Radiation Hardening: No; RoHS Compliant: Yes; Lead Free: Lead Free; Supplier Part Number 1: B5819WS-TP; ComponentLink1Description: LCSC; ComponentLink1URL: https://lcsc.com/product-detail/Schottky-Barrier-Diodes-SBD_MDD-Microdiode-Electronics-B5819WS_C64886.html
D31 = BZT52C3V3-E3-08: Diode Zener Single 3.3V 6% 500mW 2-Pin SOD-123; Manufacturer: Vishay; Max Power Dissipation: 410mW; Impedance: 80R; Voltage Tolerance: 5%; Zener Current: 109mA; Max Reverse Leakage Current: 100nA; Test Current: 5mA; ESD Protection: Yes; Supplier 1: Newark; Manufacturer Part Number: BZT52C3V3-E3-08; RoHS: Yes; Category: Zener Diodes; Pricing 1: 1=0.28100, 10=0.19500, 25=0.16300, 50=0.13100, 100=0.09800, 250=0.09200, 500=0.08500, 1000=0.05700 (USD); Mount: Surface Mount; Number of Pins: 2; Contact Plating: Tin,Matte; Min Operating Temperature: -55°C; Max Operating Temperature: 150°C; Zener Voltage: 3.3V; Element Configuration: Single; Power Dissipation: 500mW; Packaging: Tape and Reel; Package Quantity: 3000; Tolerance: 5%; Radiation Hardening: No; ComponentLink1URL: https://datasheet.ciiva.com/24094/bzt52-106265-24094953.pdf?src-supplier=Mouser; ComponentLink1Description: https://datasheet.ciiva.com/24094/bzt52-106265-24094953.pdf?src-supplier=Mouser; Supplier Part Number 1: 06AC5888
D32 D33 = ESD5451N-2/TR: DFN1006-2L ESD Protection Devices ROHS; Manufacturer: WILLSEMI; ComponentLink1Description: LCSC; ComponentLink1URL: https://www.lcsc.com/product-detail/TVS_Will-Semicon-ESD5451N-2-TR_C239604.html; Manufacturer Part Number: ESD5451N-2/TR
FB1 = MPZ1608S121ATDH5: FERRITE BEAD 120 OHM 0603 1LN; Manufacturer: TDK; Number of Lines: 1; Max Current Rating: 2A; DC Resistance (DCR): 45mR; Impedance: 120R; Tolerance: 25%; Test Frequency: 100MHz; Supplier 1: Digi-Key; Manufacturer Part Number: MPZ1608S121ATDH5; RoHS: Yes; Category: Ferrite Beads and Chips; Pricing 1: 1=0.11000, 10=0.08600, 25=0.07720, 50=0.05660, 100=0.04890, 250=0.03860, 500=0.03260, 1000=0.02746 (USD); Mount: Surface Mount; Case/Package: 0603; Case Code (Metric): 1608; Case Code (Imperial): 0603; Weight: 7.1E-05oz; Min Operating Temperature: -55°C; Max Operating Temperature: 125°C; Package Quantity: 4000; Packaging: Tape and Reel; Termination: SMD/SMT; Max DC Current: 2A; Length: 0.063inch; Width: 0.031inch; Height: 0.03inch; Ratings: AEC-Q200; RoHS Compliant: Yes; ComponentLink1URL: https://media.digikey.com/pdf/Data%20Sheets/TDK%20PDFs/MPZ_Series_Br.pdf?src-supplier=Digi-Key; ComponentLink1Description: https://media.digikey.com/pdf/Data%20Sheets/TDK%20PDFs/MPZ_Series_Br.pdf?src-supplier=Digi-Key; ComponentLink2URL: http://www.mouser.com/ds/2/400/eads_commercial_power_mpz1608_en-923650.pdf?src-supplier=Mouser; ComponentLink2Description: http://www.mouser.com/ds/2/400/eads_commercial_power_mpz1608_en-923650.pdf?src-supplier=Mouser; ComponentLink3URL: https://product.tdk.com/info/en/catalog/datasheets/beads_automotive_power_mpz1608_en.pdf?src-supplier=Digi-Key; ComponentLink3Description: https://product.tdk.com/info/en/catalog/datasheets/beads_automotive_power_mpz1608_en.pdf?src-supplier=Digi-Key; Supplier Part Number 1: 445-172891-6-ND
J9 = 0473460001: Micro-USB B Receptacle with Flange, Bottom Mount, Surface Mount, Lead-Free; Manufacturer: Molex; Manufacturer Part Number: 47346-0001; Supplier 1: Digi-Key; RoHS: Yes; Category: Headers and Wire Housings; Stock 1: 9395; Pricing 1: 1=1.10000, 10=0.91200, 100=0.75980, 1000=0.60782 (USD); ComponentLink1URL: https://datasheet.ciiva.com/30075/304740473460001-io-nectors-30075527.pdf?src-supplier=Onlinecomponents.com; ComponentLink1Description: https://datasheet.ciiva.com/30075/304740473460001-io-nectors-30075527.pdf?src-supplier=Onlinecomponents.com; ComponentLink2URL: https://datasheet.ciiva.com/22654/1630785-22654942.pdf?src-supplier=Element14; ComponentLink2Description: https://datasheet.ciiva.com/22654/1630785-22654942.pdf?src-supplier=Element14; ComponentLink3URL: https://datasheet.ciiva.com/16148/1700180473460001-io-nectors-16148917.pdf?src-supplier=Onlinecomponents.com; ComponentLink3Description: https://datasheet.ciiva.com/16148/1700180473460001-io-nectors-16148917.pdf?src-supplier=Onlinecomponents.com; ComponentLink4URL: https://datasheet.ciiva.com/11731/0900766b80dfe0a7-11731298.pdf?src-supplier=RSComponents; ComponentLink4Description: https://datasheet.ciiva.com/11731/0900766b80dfe0a7-11731298.pdf?src-supplier=RSComponents; ComponentLink5URL: https://datasheet.ciiva.com/1098/1698067-1098476.pdf?src-supplier=Element14; ComponentLink5Description: https://datasheet.ciiva.com/1098/1698067-1098476.pdf?src-supplier=Element14; ComponentLink6URL: https://datasheet.ciiva.com/4598/0473460001-io-connectors-146446-4598841.pdf?src-supplier=Mouser; ComponentLink6Description: https://datasheet.ciiva.com/4598/0473460001-io-connectors-146446-4598841.pdf?src-supplier=Mouser; ComponentLink7URL: https://datasheet.ciiva.com/28504/0473460001-io-connectors-28504587.pdf?src-supplier=Element14; ComponentLink7Description: https://datasheet.ciiva.com/28504/0473460001-io-connectors-28504587.pdf?src-supplier=Element14; ComponentLink8URL: https://datasheet.ciiva.com/46390/1681853-46390956.pdf?src-supplier=Element14; ComponentLink8Description: https://datasheet.ciiva.com/46390/1681853-46390956.pdf?src-supplier=Element14; ComponentLink9URL: https://datasheet.ciiva.com/16986/70266948-16986683.pdf?src-supplier=Allied+Electronics; ComponentLink9Description: https://datasheet.ciiva.com/16986/70266948-16986683.pdf?src-supplier=Allied+Electronics; Supplier Part Number 1: WM17141DKR-ND
J10 = DC-C024E-7A-1.65: DC Power Receptacle 1.65mm 4.3mm 7A 24V Plugin AC/DC Power Connectors ROHS; Manufacturer: XKB Connectivity; Maunfacturer Part Number: DC-C024E-7A-1.65; Footprint: Custom; ComponentLink1Description: LCSC; ComponentLink1URL: https://lcsc.com/product-detail/AC-span-style-background-color-ff0-DC-span-Power-Connectors_XKB-Connectivity-DC-C024E-7A-1-65_C397335.html
J11 = CR1220-2: SMD Battery Holders, Clips & Contacts RoHS; Manufacturer: Q&J; Value: Cuctom; Manufacturer Part No: CR1220-2; Package: Cuctom
J12 = B2B-XH-A(LF)(SN): Conn Shrouded Header (4 Sides) HDR 2 POS 2.5mm Solder ST Thru-Hole Box; Manufacturer: JST; Number of Positions: 2; Connector Type: Male Pin; Current Rating: 3A; Contact Resistance: 20mR; Voltage Rating: 250V; Insulation Resistance: 1GR; Wire/Cable Gauge: 22AWG; Supplier 1: Farnell; Manufacturer Part Number: B2B-XH-A(LF)(SN); RoHS: Yes; Category: FFC / FPC; Stock 1: 219240; Pricing 1: 100=0.06860, 1000=0.04800, 2500=0.04520, 5000=0.04230, 10000=0.03950, 20000=0.03660 (GBP); Mount: Through Hole; Contact Plating: Tin,Copper,Lead; Color: Natural; Contact Material: Brass; Housing Color: White; Housing Material: Polyamide; Min Operating Temperature: -25°C; Max Operating Temperature: 85°C; Number of Rows: 1; Packaging: Bulk; Termination: Solder; Fastening Type: Detent; Max Current Rating: 3A; Voltage Rating (AC): 250V; Max Voltage Rating (AC): 250V; Number of Contacts: 2; Max Voltage Rating (DC): 250V; Orientation: Straight; Length: 7.4mm; Pitch: 2.5mm; Lead Pitch: 2.5mm; Depth: 5.75mm; REACH SVHC: No SVHC; Lead Free: Lead Free; ComponentLink1URL: https://datasheet.ciiva.com/26894/getdatasheetpartid-640357-26894434.pdf?src-supplier=Verical; ComponentLink1Description: https://datasheet.ciiva.com/26894/getdatasheetpartid-640357-26894434.pdf?src-supplier=Verical; ComponentLink2URL: https://datasheet.ciiva.com/11746/0900766b8082653e-11746979.pdf?src-supplier=RSComponents; ComponentLink2Description: https://datasheet.ciiva.com/11746/0900766b8082653e-11746979.pdf?src-supplier=RSComponents; ComponentLink3URL: https://datasheet.ciiva.com/26894/getdatasheetpartid-385291-26894760.pdf?src-supplier=Verical; ComponentLink3Description: https://datasheet.ciiva.com/26894/getdatasheetpartid-385291-26894760.pdf?src-supplier=Verical; ComponentLink4URL: https://datasheet.ciiva.com/8052/5448-8052024.pdf?src-supplier=Element14; ComponentLink4Description: https://datasheet.ciiva.com/8052/5448-8052024.pdf?src-supplier=Element14; ComponentLink5URL: https://datasheet.ciiva.com/20207/523653-20207167.pdf?src-supplier=Rapid+Electronics; ComponentLink5Description: https://datasheet.ciiva.com/20207/523653-20207167.pdf?src-supplier=Rapid+Electronics; Supplier Part Number 1: 1516276
LED2 = XZVG68W-2: LED GREEN CLEAR CHIP SMD; Manufacturer: SunLED; Lens Color: Colorless; Luminous Intensity: 49mcd; Test Current: 20mA; Viewing Angle: 120°; Dominant Wavelength: 570nm; Forward Voltage: 2.1V; Supplier 1: Digi-Key; Manufacturer Part Number: XZVG68W-2; Stock 1: 4185; Pricing 1: 1=0.5, 10=0.36, 100=0.16, 500=0.112, 1000=0.092 (USD); Mount: Surface Mount; Case/Package: 0402; Color: Green; Case Code (Metric): 1005; Case Code (Imperial): 0402; Packaging: Tape and Reel; Lens Transparency: Clear; Length: 1mm; Height: 0.6mm; Width: 0.5mm; ComponentLink1URL: http://www.sunledusa.com/products/spec/XZVG68W-2.pdf?src-supplier=Digi-Key; ComponentLink1Description: http://www.sunledusa.com/products/spec/XZVG68W-2.pdf?src-supplier=Digi-Key; ComponentLink2URL: https://www.sunledusa.com/products/spec/XZVG68W-2.pdf?src-supplier=Digi-Key; ComponentLink2Description: https://www.sunledusa.com/products/spec/XZVG68W-2.pdf?src-supplier=Digi-Key; Supplier Part Number 1: 1497-1219-6-ND
LED3 = XZMDK68W-2: LED RED CLEAR CHIP SMD; Manufacturer: SunLED; Lens Color: Colorless; Luminous Intensity: 69mcd; Test Current: 20mA; Viewing Angle: 120°; Dominant Wavelength: 630nm; Forward Voltage: 1.95V; Supplier 1: Digi-Key; Manufacturer Part Number: XZMDK68W-2; Stock 1: 69539; Pricing 1: 1=0.43, 10=0.306, 100=0.136, 500=0.0952, 1000=0.0782 (USD); Mount: Surface Mount; Case/Package: 0402; Color: Red; Case Code (Metric): 1005; Case Code (Imperial): 0402; Packaging: Tape and Reel; Lens Transparency: Clear; Length: 1mm; Height: 0.6mm; Width: 0.5mm; ComponentLink1URL: http://www.sunledusa.com/products/spec/XZMDK68W-2.pdf?src-supplier=Digi-Key; ComponentLink1Description: http://www.sunledusa.com/products/spec/XZMDK68W-2.pdf?src-supplier=Digi-Key; ComponentLink2URL: https://www.sunledusa.com/products/spec/XZMDK68W-2.pdf?src-supplier=Digi-Key; ComponentLink2Description: https://www.sunledusa.com/products/spec/XZMDK68W-2.pdf?src-supplier=Digi-Key; Supplier Part Number 1: 1497-1174-6-ND
LED4 = XZMYK68W-2: LED YELLOW CLEAR CHIP SMD; Manufacturer: SunLED; Lens Color: Colorless; Luminous Intensity: 148mcd; Test Current: 20mA; Viewing Angle: 120°; Dominant Wavelength: 590nm; Forward Voltage: 2V; Supplier 1: Digi-Key; Manufacturer Part Number: XZMYK68W-2; RoHS: Yes; Category: LEDs; Stock 1: 36021; Pricing 1: 1=0.36000, 10=0.28400, 100=0.12770, 500=0.11536, 1000=0.09476 (USD); Mount: Surface Mount; Case/Package: 0402; Color: Yellow; Case Code (Metric): 1005; Case Code (Imperial): 0402; Packaging: Tape and Reel; Lens Transparency: Clear; Length: 1mm; Width: 0.5mm; Height: 0.6mm; RoHS Compliant: Yes; ComponentLink1URL: http://www.sunledusa.com/products/spec/XZMYK68W-2.pdf?src-supplier=Digi-Key; ComponentLink1Description: http://www.sunledusa.com/products/spec/XZMYK68W-2.pdf?src-supplier=Digi-Key; Supplier Part Number 1: 1497-1198-1-ND
P40 = 61300311121: CONN HEADER VERT 3POS 2.54MM; Manufacturer: Wurth Electronics; Number of Positions: 3; Gender: Male; Connector Type: Male Pin; Pitch: 0.1inch; Supplier 1: Digi-Key; Manufacturer Part Number: 61300311121; Stock 1: 81286; Pricing 1: 1=0.13, 10=0.106, 25=0.088, 50=0.074, 100=0.067, 1000=0.061 (USD); Mount: Through Hole; Contact Plating: Gold; Contact Material: Copper; Color: Black; Number of Rows: 1; Packaging: Bulk; Termination: Solder; Number of Contacts: 3; Contact Mating Length: 0.236inch; REACH SVHC: Unknown; Lead Free: Lead Free; ComponentLink1URL: http://www.farnell.com/cad/1737268.pdf?src-supplier=Element14; ComponentLink1Description: http://www.farnell.com/cad/1737268.pdf?src-supplier=Element14; ComponentLink2URL: https://katalog.we-online.de/em/datasheet/6130xx11121.pdf?src-supplier=Digi-Key; ComponentLink2Description: https://katalog.we-online.de/em/datasheet/6130xx11121.pdf?src-supplier=Digi-Key; Supplier Part Number 1: 732-5316-ND
Q7 = SI2302-TP: SI2302 Series 20 3 A N-Ch Enhancement Mode Field Effect Transistor - SOT-23-3; Manufacturer: MCC; Rds On Max: 72mR; Input Capacitance: 237pF; Drain to Source Voltage (Vdss): 20V; Continuous Drain Current (ID): 3A; Max Power Dissipation: 1.25W; Drain to Source Resistance: 110mR; Number of Elements: 1; Gate to Source Voltage (Vgs): 8V; Polarity: N-CHANNEL; Supplier 1: Digi-Key; Manufacturer Part Number: SI2302-TP; RoHS: Yes; Category: Transistors; Stock 1: 13753; Pricing 1: 1=0.50000, 10=0.40300, 100=0.27460, 500=0.20592, 1000=0.15444 (USD); Mount: Surface Mount; Case/Package: SOT-23; Number of Pins: 3; Min Operating Temperature: -55°C; Max Operating Temperature: 150°C; Packaging: Tape and Reel; Package Quantity: 3000; Drain to Source Breakdown Voltage: 20V; Power Dissipation: 1.25W; Lead Free: Lead Free; RoHS Compliant: Yes; ComponentLink1URL: https://datasheet.ciiva.com/935/si2302sot-23-935107.pdf?src-supplier=Digi-Key; ComponentLink1Description: https://datasheet.ciiva.com/935/si2302sot-23-935107.pdf?src-supplier=Digi-Key; ComponentLink2URL: https://datasheet.ciiva.com/935/si2302sot-23-935109.pdf?src-supplier=Digi-Key; ComponentLink2Description: https://datasheet.ciiva.com/935/si2302sot-23-935109.pdf?src-supplier=Digi-Key; ComponentLink3URL: https://datasheet.ciiva.com/935/si2302sot-23-935108.pdf?src-supplier=Digi-Key; ComponentLink3Description: https://datasheet.ciiva.com/935/si2302sot-23-935108.pdf?src-supplier=Digi-Key; Supplier Part Number 1: SI2302-TPMSCT-ND
Q8-Q10 = S8050: as Q6 on sheet WiFi_Module_Section; Supplier 1: Arrow Electronics; RoHS: Yes; Stock 1: 2514; Pricing 1: 1=0.26480, 10=0.19960, 25=0.19760, 50=0.19590, 100=0.09990, 250=0.09890, 500=0.07670, 1000=0.05180 (USD); Mount: Surface Mount; Case/Package: TO-236-3; Packaging: Tape and Reel; Max Power Dissipation: 300mW; Max Collector Current: 1.5A; Collector Emitter Breakdown Voltage: 25V; Max Breakdown Voltage: 25V; ComponentLink1URL: http://www.comchiptech.com/admin/files/product/SS8050-G RevA181526.pdf?src-supplier=Digi-Key; ComponentLink1Description: http://www.comchiptech.com/admin/files/product/SS8050-G RevA181526.pdf?src-supplier=Digi-Key; ComponentLink2URL: http://www.comchiptech.com/cms/UserFiles/SS8050-G%20RevA181526.pdf?src-supplier=Digi-Key; ComponentLink2Description: http://www.comchiptech.com/cms/UserFiles/SS8050-G%20RevA181526.pdf?src-supplier=Digi-Key; Supplier Part Number 1: SS8050-G
R116 R120-R122 = FRC0603J101 TS: 100mW Thick Film Resistors 50V ±5% ±100ppm/℃ -55℃~+155℃ 100Ω 0603 Chip Resistor - Surface Mount ROHS; Manufacturer: FOJAN; Manufacturer Part Number: FRC0603J101 TS; Value: 100R; Footprint: 0603
R117 R118 R123-R125 = AC0603JR-0710KL: as R113 on sheet WiFi_Module_Section; Supplier 1: Future Electronics; Manufacturer Part Number: AC0603JR-0710KL; RoHS: Yes; Category: Chip SMD Resistors; Stock 1: 1533000; Pricing 1: 5000=0.00540 (USD); Case/Package: 0603; Case Code (Imperial): 0603; Case Code (Metric): 1608; Size Code: 0603; Min Operating Temperature: -55°C; Max Operating Temperature: 155°C; Packaging: Tape and Reel; Tolerance: 5%; Package Quantity: 1; Resistor Type: Thick Film; Termination: SMD/SMT; Number of Terminations: 2; Max Power Dissipation: 100mW; Features: Moisture Resistant,Automotive AEC-Q200,Anti-Sulfur; Series: AC; Construction: Rectangular; Length: 0.063inch; Width: 0.031inch; Height: 0.022inch; Depth: 0.8mm; Military Standard: Not; Lead Free: Lead Free; RoHS Compliant: Yes; ComponentLink1URL: https://datasheet.ciiva.com/5562/pyu-ac-51-rohs-l-2-5562553.pdf?src-supplier=Mouser; ComponentLink1Description: https://datasheet.ciiva.com/5562/pyu-ac-51-rohs-l-2-5562553.pdf?src-supplier=Mouser; Supplier Part Number 1: 1029044
R119 = RT0603BRD07100KL: RES SMD 100K OHM 0.1% 1/10W 0603; Manufacturer: Yageo; Resistance: 100kR; Temperature Coefficient: 25ppm/°C; Voltage Rating (DC): 75V; Power Rating: 100mW; Supplier 1: Digi-Key; Manufacturer Part Number: RT0603BRD07100KL; Stock 1: 53395; Pricing 1: 1=0.39, 10=0.332, 100=0.1298, 1000=0.05435, 2500=0.04982 (USD); Mount: Surface Mount; Case/Package: 0603; Case Code (Imperial): 0603; Case Code (Metric): 1608; Min Operating Temperature: -55°C; Max Operating Temperature: 125°C; Tolerance: 0.1%; Composition: Thin Film; Packaging: Tape and Reel; Voltage Rating: 75V; Package Quantity: 5000; Termination: SMD/SMT; Number of Terminations: 2; Military Standard: Not; Max Power Dissipation: 100mW; Working Voltage: 75V; Features: Moisture Resistant; Length: 1.6mm; Height: 0.022inch; Width: 0.031inch; Depth: 0.8mm; Lead Free: Lead Free; ComponentLink1URL: http://documents.rs-components.com/techlib://itc_doclist_GB.htm?stockno=6174810&src-supplier=RSComponents; ComponentLink1Description: http://documents.rs-components.com/techlib://itc_doclist_GB.htm?stockno=6174810&src-supplier=RSComponents; Supplier Part Number 1: YAG1235CT-ND
SB33 = Solder Bridge: Solder Bridge ON

## Sheet Power_Section.SchDoc
size A4; DocumentNumber: 2; SheetNumber: 2; SheetTotal: 27
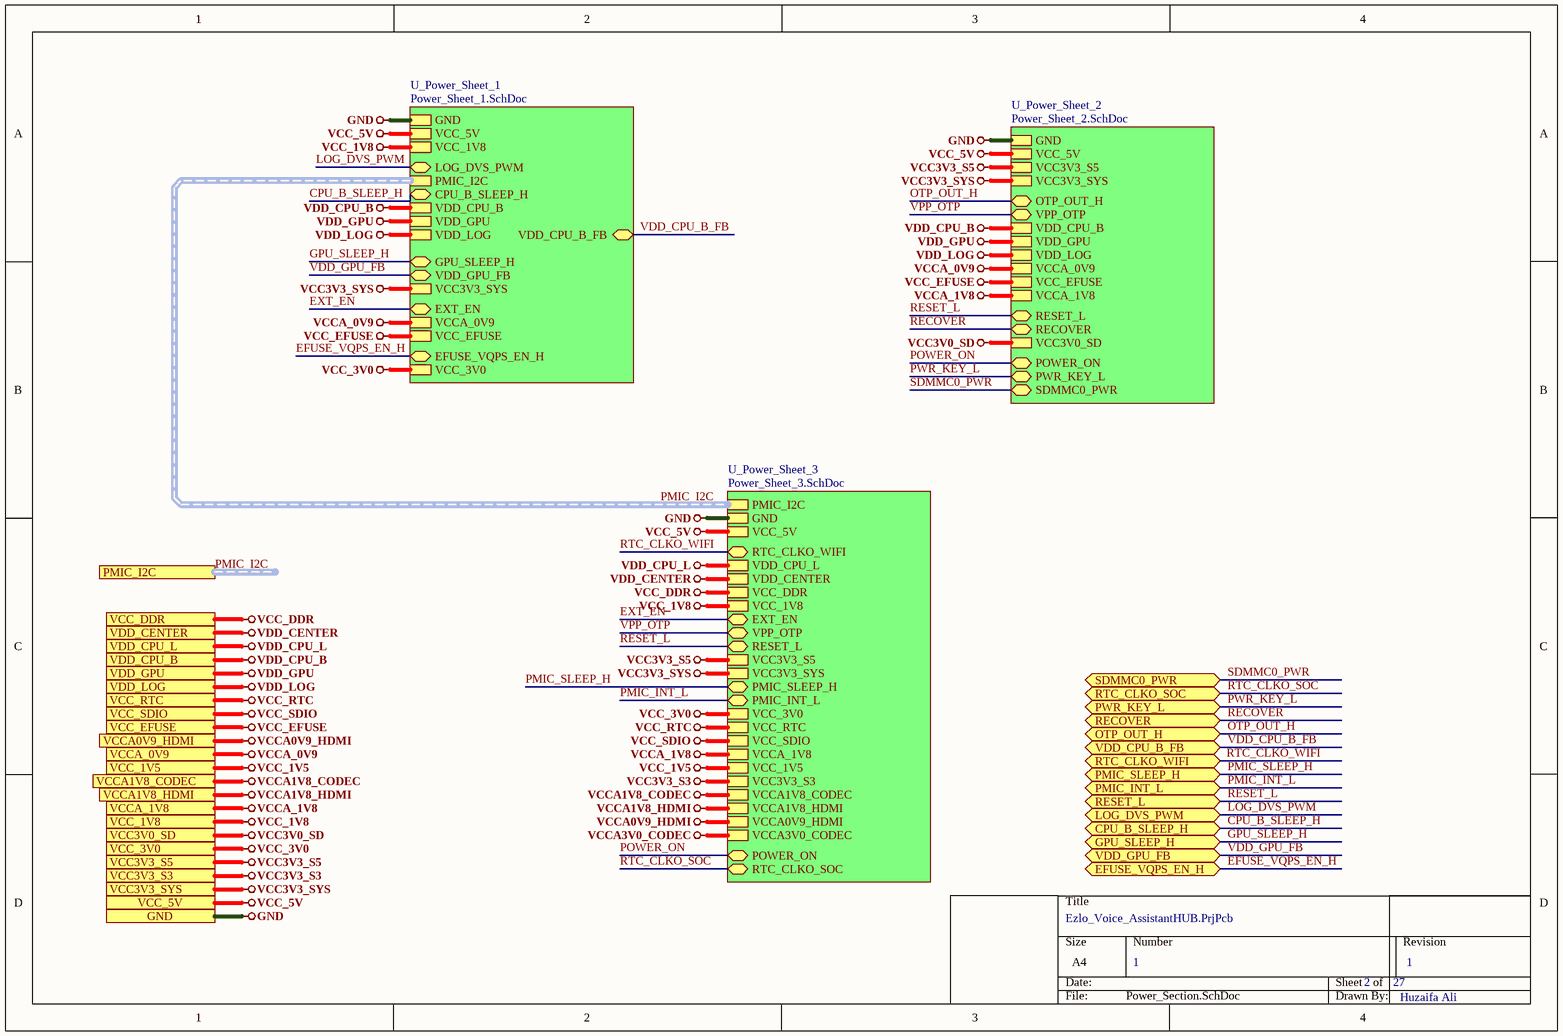
[diagram p4: Power_Section.SchDoc]

### Sub-sheets
U_Power_Sheet_1 = Power_Sheet_1.SchDoc: GND, VCC_5V, VCC_1V8, LOG_DVS_PWM (bidir), PMIC_I2C (harness PMIC_I2C), CPU_B_SLEEP_H (bidir), VDD_CPU_B, VDD_GPU, VDD_LOG, VDD_CPU_B_FB (bidir), GPU_SLEEP_H (bidir), VDD_GPU_FB (bidir), VCC3V3_SYS, EXT_EN (bidir), VCCA_0V9, VCC_EFUSE, EFUSE_VQPS_EN_H (bidir), VCC_3V0
U_Power_Sheet_2 = Power_Sheet_2.SchDoc: GND, VCC_5V, VCC3V3_S5, VCC3V3_SYS, OTP_OUT_H (bidir), VPP_OTP (bidir), VDD_CPU_B, VDD_GPU, VDD_LOG, VCCA_0V9, VCC_EFUSE, VCCA_1V8, RESET_L (bidir), RECOVER (bidir), VCC3V0_SD, POWER_ON (bidir), PWR_KEY_L (bidir), SDMMC0_PWR (bidir)
U_Power_Sheet_3 = Power_Sheet_3.SchDoc: PMIC_I2C (harness PMIC_I2C), GND, VCC_5V, RTC_CLKO_WIFI (bidir), VDD_CPU_L, VDD_CENTER, VCC_DDR, VCC_1V8, EXT_EN (bidir), VPP_OTP (bidir), RESET_L (bidir), VCC3V3_S5, VCC3V3_SYS, PMIC_SLEEP_H (bidir), PMIC_INT_L (bidir), VCC_3V0, VCC_RTC, VCC_SDIO, VCCA_1V8, VCC_1V5, VCC3V3_S3, VCCA1V8_CODEC, VCCA1V8_HDMI, VCCA0V9_HDMI, VCCA3V0_CODEC, POWER_ON (bidir), RTC_CLKO_SOC (bidir)

### Ports
CPU_B_SLEEP_H (bidir), EFUSE_VQPS_EN_H (bidir), GND, GPU_SLEEP_H (bidir), LOG_DVS_PWM (bidir), OTP_OUT_H (bidir), PMIC_I2C (harness PMIC_I2C), PMIC_INT_L (bidir), PMIC_SLEEP_H (bidir), PWR_KEY_L (bidir), RECOVER (bidir), RESET_L (bidir), RTC_CLKO_SOC (bidir), RTC_CLKO_WIFI (bidir), SDMMC0_PWR (bidir), VCC3V0_SD, VCC3V3_S3, VCC3V3_S5, VCC3V3_SYS, VCC_1V5, VCC_1V8, VCC_3V0, VCC_5V, VCC_DDR, VCC_EFUSE, VCC_RTC, VCC_SDIO, VCCA0V9_HDMI, VCCA1V8_CODEC, VCCA1V8_HDMI, VCCA_0V9, VCCA_1V8, VDD_CENTER, VDD_CPU_B, VDD_CPU_B_FB (bidir), VDD_CPU_L, VDD_GPU, VDD_GPU_FB (bidir), VDD_LOG

### Nets
GND: port GND, sheet U_Power_Sheet_1/GND, sheet U_Power_Sheet_3/GND, sheet U_Power_Sheet_2/GND
VCC3V0_SD: port VCC3V0_SD, sheet U_Power_Sheet_2/VCC3V0_SD
VCC3V3_S3: port VCC3V3_S3, sheet U_Power_Sheet_3/VCC3V3_S3
VCC3V3_S5: port VCC3V3_S5, sheet U_Power_Sheet_3/VCC3V3_S5, sheet U_Power_Sheet_2/VCC3V3_S5
VCC3V3_SYS: port VCC3V3_SYS, sheet U_Power_Sheet_1/VCC3V3_SYS, sheet U_Power_Sheet_3/VCC3V3_SYS, sheet U_Power_Sheet_2/VCC3V3_SYS
VCC_1V5: port VCC_1V5, sheet U_Power_Sheet_3/VCC_1V5
VCC_1V8: port VCC_1V8, sheet U_Power_Sheet_1/VCC_1V8, sheet U_Power_Sheet_3/VCC_1V8
VCC_3V0: port VCC_3V0, sheet U_Power_Sheet_1/VCC_3V0, sheet U_Power_Sheet_3/VCC_3V0
VCC_5V: port VCC_5V, sheet U_Power_Sheet_1/VCC_5V, sheet U_Power_Sheet_3/VCC_5V, sheet U_Power_Sheet_2/VCC_5V
VCC_DDR: port VCC_DDR, sheet U_Power_Sheet_3/VCC_DDR
VCC_EFUSE: port VCC_EFUSE, sheet U_Power_Sheet_1/VCC_EFUSE, sheet U_Power_Sheet_2/VCC_EFUSE
VCC_RTC: port VCC_RTC, sheet U_Power_Sheet_3/VCC_RTC
VCC_SDIO: port VCC_SDIO, sheet U_Power_Sheet_3/VCC_SDIO
VCCA0V9_HDMI: port VCCA0V9_HDMI, sheet U_Power_Sheet_3/VCCA0V9_HDMI
VCCA1V8_CODEC: port VCCA1V8_CODEC, sheet U_Power_Sheet_3/VCCA1V8_CODEC
VCCA1V8_HDMI: port VCCA1V8_HDMI, sheet U_Power_Sheet_3/VCCA1V8_HDMI
VCCA_0V9: port VCCA_0V9, sheet U_Power_Sheet_1/VCCA_0V9, sheet U_Power_Sheet_2/VCCA_0V9
VCCA_1V8: port VCCA_1V8, sheet U_Power_Sheet_3/VCCA_1V8, sheet U_Power_Sheet_2/VCCA_1V8
VDD_CENTER: port VDD_CENTER, sheet U_Power_Sheet_3/VDD_CENTER
VDD_CPU_B: port VDD_CPU_B, sheet U_Power_Sheet_1/VDD_CPU_B, sheet U_Power_Sheet_2/VDD_CPU_B
VDD_CPU_L: port VDD_CPU_L, sheet U_Power_Sheet_3/VDD_CPU_L
VDD_GPU: port VDD_GPU, sheet U_Power_Sheet_1/VDD_GPU, sheet U_Power_Sheet_2/VDD_GPU
VDD_LOG: port VDD_LOG, sheet U_Power_Sheet_1/VDD_LOG, sheet U_Power_Sheet_2/VDD_LOG
CPU_B_SLEEP_H: port CPU_B_SLEEP_H, sheet U_Power_Sheet_1/CPU_B_SLEEP_H
EFUSE_VQPS_EN_H: port EFUSE_VQPS_EN_H, sheet U_Power_Sheet_1/EFUSE_VQPS_EN_H
EXT_EN: sheet U_Power_Sheet_1/EXT_EN, sheet U_Power_Sheet_3/EXT_EN
GPU_SLEEP_H: port GPU_SLEEP_H, sheet U_Power_Sheet_1/GPU_SLEEP_H
LOG_DVS_PWM: port LOG_DVS_PWM, sheet U_Power_Sheet_1/LOG_DVS_PWM
OTP_OUT_H: port OTP_OUT_H, sheet U_Power_Sheet_2/OTP_OUT_H
PMIC_INT_L: port PMIC_INT_L, sheet U_Power_Sheet_3/PMIC_INT_L
PMIC_SLEEP_H: port PMIC_SLEEP_H, sheet U_Power_Sheet_3/PMIC_SLEEP_H
POWER_ON: sheet U_Power_Sheet_3/POWER_ON, sheet U_Power_Sheet_2/POWER_ON
PWR_KEY_L: port PWR_KEY_L, sheet U_Power_Sheet_2/PWR_KEY_L
RECOVER: port RECOVER, sheet U_Power_Sheet_2/RECOVER
RESET_L: port RESET_L, sheet U_Power_Sheet_3/RESET_L, sheet U_Power_Sheet_2/RESET_L
RTC_CLKO_SOC: port RTC_CLKO_SOC, sheet U_Power_Sheet_3/RTC_CLKO_SOC
RTC_CLKO_WIFI: port RTC_CLKO_WIFI, sheet U_Power_Sheet_3/RTC_CLKO_WIFI
SDMMC0_PWR: port SDMMC0_PWR, sheet U_Power_Sheet_2/SDMMC0_PWR
VDD_CPU_B_FB: port VDD_CPU_B_FB, sheet U_Power_Sheet_1/VDD_CPU_B_FB
VDD_GPU_FB: port VDD_GPU_FB, sheet U_Power_Sheet_1/VDD_GPU_FB
VPP_OTP: sheet U_Power_Sheet_3/VPP_OTP, sheet U_Power_Sheet_2/VPP_OTP

### Buses and harness runs
harness PMIC_I2C = port PMIC_I2C
harness PMIC_I2C = sheet U_Power_Sheet_1/PMIC_I2C = sheet U_Power_Sheet_3/PMIC_I2C

### Notes on the sheet
- 1
- Huzaifa Ali